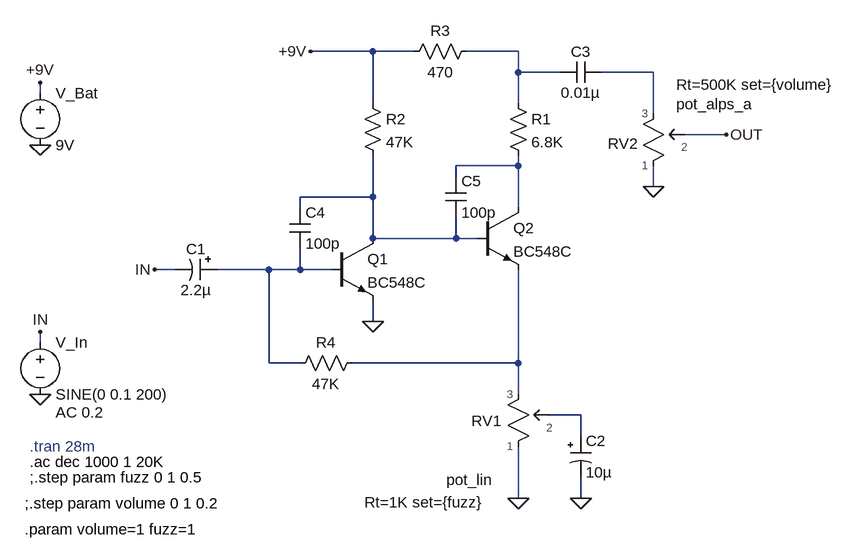
[diagram p0: schematic FuzzFace.asc]
FuzzFace.asc, the LTspice schematic file:
Version 4.1
SHEET 1 1132 680
WIRE 384 -176 288 -176
WIRE 448 -176 384 -176
WIRE 608 -176 528 -176
WIRE 608 -144 608 -176
WIRE 672 -144 608 -144
WIRE 816 -144 736 -144
WIRE -128 -112 -128 -128
WIRE 384 -96 384 -176
WIRE 608 -96 608 -144
WIRE 816 -80 816 -144
WIRE 928 -48 864 -48
WIRE 608 0 608 -16
WIRE 608 0 512 0
WIRE 512 16 512 0
WIRE 816 32 816 0
WIRE 384 48 384 -16
WIRE 384 48 272 48
WIRE 272 64 272 48
WIRE 608 64 608 0
WIRE 384 112 384 48
WIRE 512 112 512 80
WIRE 512 112 384 112
WIRE 544 112 512 112
WIRE 80 160 48 160
WIRE 224 160 144 160
WIRE 272 160 272 128
WIRE 272 160 224 160
WIRE 320 160 272 160
WIRE 384 240 384 208
WIRE -128 272 -128 256
WIRE 224 304 224 160
WIRE 272 304 224 304
WIRE 608 304 608 160
WIRE 608 304 352 304
WIRE 608 352 608 304
WIRE 704 384 656 384
WIRE 704 416 704 384
WIRE 608 512 608 432
WIRE 704 512 704 480
FLAG -128 352 0
FLAG 48 160 IN
FLAG -128 256 IN
FLAG 384 240 0
FLAG -128 -32 0
FLAG -128 -128 +9V
FLAG 288 -176 +9V
FLAG 704 512 0
FLAG 608 512 0
FLAG 816 32 0
FLAG 928 -48 OUT
SYMBOL polcap 144 144 R90
WINDOW 0 0 32 VBottom 2
WINDOW 3 32 32 VTop 2
SYMATTR InstName C1
SYMATTR Value 2.2µ
SYMBOL voltage -128 256 R0
WINDOW 123 24 124 Left 2
WINDOW 39 0 0 Left 0
SYMATTR Value2 AC 0.2
SYMATTR InstName V_In
SYMATTR Value SINE(0 0.1 200)
SYMBOL npn 320 112 R0
SYMATTR InstName Q1
SYMATTR Value BC548C
SYMBOL npn 544 64 R0
SYMATTR InstName Q2
SYMATTR Value BC548C
SYMBOL cap 256 64 R0
SYMATTR InstName C4
SYMATTR Value 100p
SYMBOL cap 496 16 R0
SYMATTR InstName C5
SYMATTR Value 100p
SYMBOL res 592 -112 R0
SYMATTR InstName R1
SYMATTR Value 6.8K
SYMBOL res 368 -112 R0
SYMATTR InstName R2
SYMATTR Value 47K
SYMBOL res 544 -192 R90
WINDOW 0 0 56 VBottom 2
WINDOW 3 32 56 VTop 2
SYMATTR InstName R3
SYMATTR Value 470
SYMBOL cap 736 -160 R90
WINDOW 0 0 32 VBottom 2
WINDOW 3 32 32 VTop 2
SYMATTR InstName C3
SYMATTR Value 0.01µ
SYMBOL fuzzface\\SpicePot\\pot 592 448 M180
WINDOW 0 -56 55 Left 2
WINDOW 3 -221 -70 Left 2
WINDOW 38 -95 -36 Left 2
SYMATTR InstName RV1
SYMATTR Value Rt=1K set={fuzz}
SYMATTR SpiceLine ""
SYMBOL fuzzface\\SpicePot\\pot 800 16 M180
WINDOW 0 -54 50 Left 2
WINDOW 3 51 141 Left 2
WINDOW 38 51 111 Left 2
SYMATTR InstName RV2
SYMATTR Value Rt=500K set={volume}
SYMATTR SpiceModel pot_alps_a
SYMATTR SpiceLine ""
SYMBOL voltage -128 -128 R0
WINDOW 123 0 0 Left 0
WINDOW 39 0 0 Left 0
SYMATTR InstName V_Bat
SYMATTR Value 9V
SYMBOL res 368 288 R90
WINDOW 0 0 56 VBottom 2
WINDOW 3 32 56 VTop 2
SYMATTR InstName R4
SYMATTR Value 47K
SYMBOL polcap 688 416 R0
SYMATTR InstName C2
SYMATTR Value 10µ
TEXT -144 432 Left 2 ;.tran 28m
TEXT -152 560 Left 2 !.param volume=1 fuzz=1
TEXT -152 520 Left 2 !;.step param volume 0 1 0.2
TEXT -144 480 Left 2 !;.step param fuzz 0 1 0.5
TEXT -144 456 Left 2 !.ac dec 1000 1 20K

The netlist it stands for:
* FuzzFace.asc
C1 N005 IN 2.2µ
V_In IN 0 SINE(0 0.1 200) AC 0.2
Q1 N004 N005 0 0 BC548C
Q2 N003 N004 N006 0 BC548C
C4 N004 N005 100p
C5 N003 N004 100p
R1 N001 N003 6.8K
R2 +9V N004 47K
R3 N001 +9V 470
C3 N002 N001 0.01µ
X§RV1 0 N007 N006 pot_lin Rt=1K set={fuzz}  ; pins 1 2 3
X§RV2 0 OUT N002 pot_alps_a Rt=500K set={volume}  ; pins 1 2 3
V_Bat +9V 0 9V
R4 N006 N005 47K
C2 N007 0 10µ
.model NPN NPN
.model PNP PNP
.lib standard.bjt
* .tran 28m
.param volume=1 fuzz=1
;.step param volume 0 1 0.2
;.step param fuzz 0 1 0.5
.ac dec 1000 1 20K
.lib pot.lib
.backanno
.end